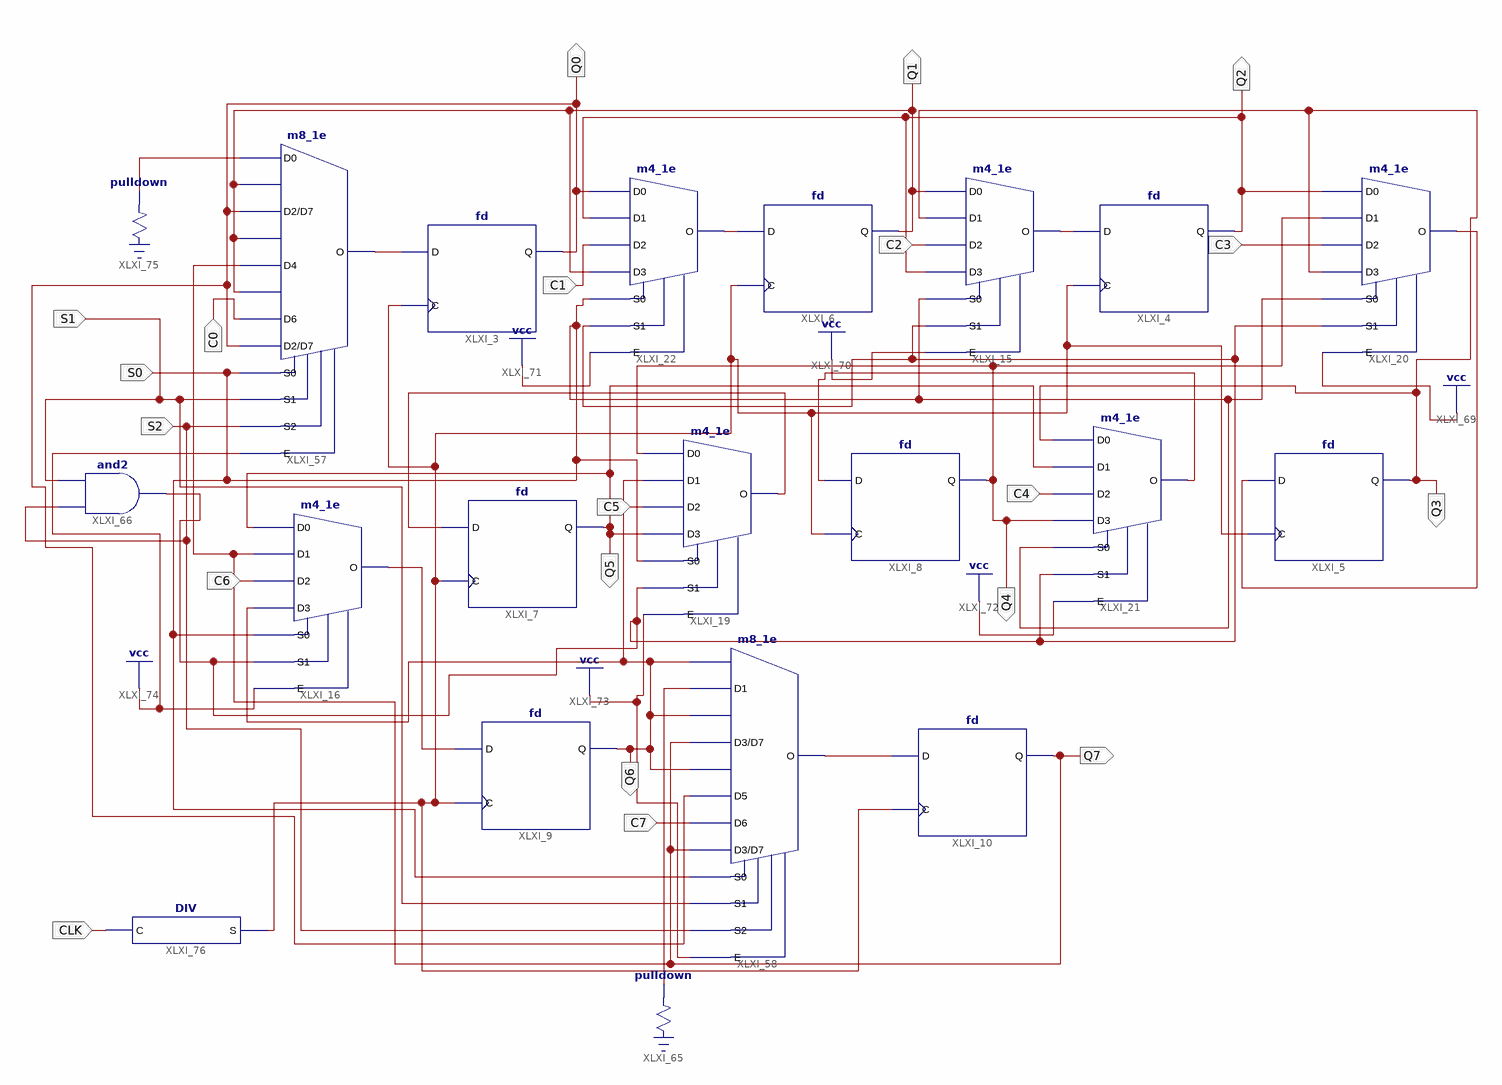
[diagram p0: schematic sheet 1]
// Xilinx ISE schematic main.sch (spartan3e) as structural Verilog: 20 symbols, 20 ports
module main (
  input  C0,
  input  C1,
  input  C2,
  input  C3,
  input  C4,
  input  C5,
  input  C6,
  input  C7,
  input  S1,
  input  S2,
  input  S0,
  input  CLK,
  output Q1,
  output Q2,
  output Q0,
  output Q4,
  output Q5,
  output Q6,
  output Q7,
  output Q3
);

  wire XLXN_21, XLXN_34, XLXN_63, XLXN_85, XLXN_90, XLXN_91, XLXN_96, XLXN_98, XLXN_101, XLXN_148, XLXN_149,
       XLXN_155;

  fd XLXI_5 (.C(XLXN_155), .D(XLXN_98), .Q(Q3));
  fd XLXI_7 (.C(XLXN_155), .D(XLXN_85), .Q(Q5));
  fd XLXI_8 (.C(XLXN_155), .D(XLXN_101), .Q(Q4));
  fd XLXI_9 (.C(XLXN_155), .D(XLXN_90), .Q(Q6));
  m4_1e XLXI_16 (.D0(Q5), .D1(Q7), .D2(C6), .D3(Q6), .E(1'b1), .S0(S0), .S1(XLXN_148), .O(XLXN_90));
  m4_1e XLXI_19 (.D0(Q4), .D1(Q6), .D2(C5), .D3(Q5), .E(1'b1), .S0(S0), .S1(XLXN_148), .O(XLXN_85));
  m4_1e XLXI_21 (.D0(Q3), .D1(Q5), .D2(C4), .D3(Q4), .E(1'b1), .S0(S0), .S1(XLXN_148), .O(XLXN_101));
  m4_1e XLXI_22 (.D0(Q0), .D1(Q2), .D2(C1), .D3(Q1), .E(1'b1), .S0(S0), .S1(XLXN_148), .O(XLXN_21));
  fd XLXI_3 (.C(XLXN_155), .D(XLXN_63), .Q(Q0));
  fd XLXI_6 (.C(XLXN_155), .D(XLXN_21), .Q(Q1));
  m4_1e XLXI_15 (.D0(Q1), .D1(Q3), .D2(C2), .D3(Q2), .E(1'b1), .S0(S0), .S1(XLXN_148), .O(XLXN_34));
  fd XLXI_4 (.C(XLXN_155), .D(XLXN_34), .Q(Q2));
  m4_1e XLXI_20 (.D0(Q2), .D1(Q4), .D2(C3), .D3(Q3), .E(1'b1), .S0(S0), .S1(XLXN_148), .O(XLXN_98));
  m8_1e XLXI_57 (
    .D0(XLXN_149), .D1(Q1), .D2(Q0), .D3(Q1), .D4(Q7), .D5(Q1), .D6(C0), .D7(Q0), .E(1'b1), .S0(S0), .S1(S1),
    .S2(S2), .O(XLXN_63));
  m8_1e XLXI_58 (
    .D0(Q6), .D1(XLXN_96), .D2(Q6), .D3(Q7), .D4(Q6), .D5(Q0), .D6(C7), .D7(Q7), .E(1'b1), .S0(S0), .S1(S1),
    .S2(S2), .O(XLXN_91));
  fd XLXI_10 (.C(XLXN_155), .D(XLXN_91), .Q(Q7));
  \pulldown  XLXI_65 (.O(XLXN_96));
  and XLXI_66 (XLXN_148, S2, S1);
  \pulldown  XLXI_75 (.O(XLXN_149));
  DIV XLXI_76 (.C(CLK), .S(XLXN_155));
endmodule
